# Altium schematic sheet SIO - IT8784E.schdoc
size 297 x 210 mm; Symbol: Sheet-Symbol_A4; Company: 嘉立创EDA; Version: V1.0; Page Size: A4; @Project Name: 【全网首发】X86电脑主板_copy; @Page Count: 13; @Update Date: 2025-10-09; @Create Date: 2025-10-09; @Schematic Name: SCHEMATIC1_1; @Page No: 0; @Page Name: SIO - IT8784E; Device: Sheet-Symbol_A4_1
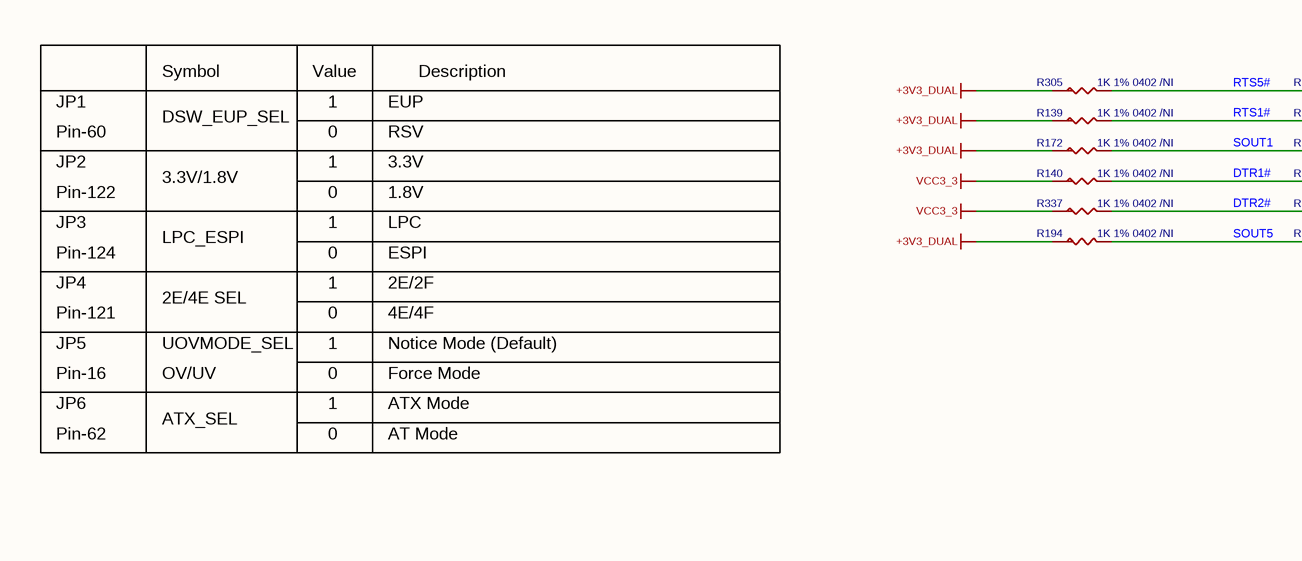
[diagram p0: SIO - IT8784E.schdoc, left]
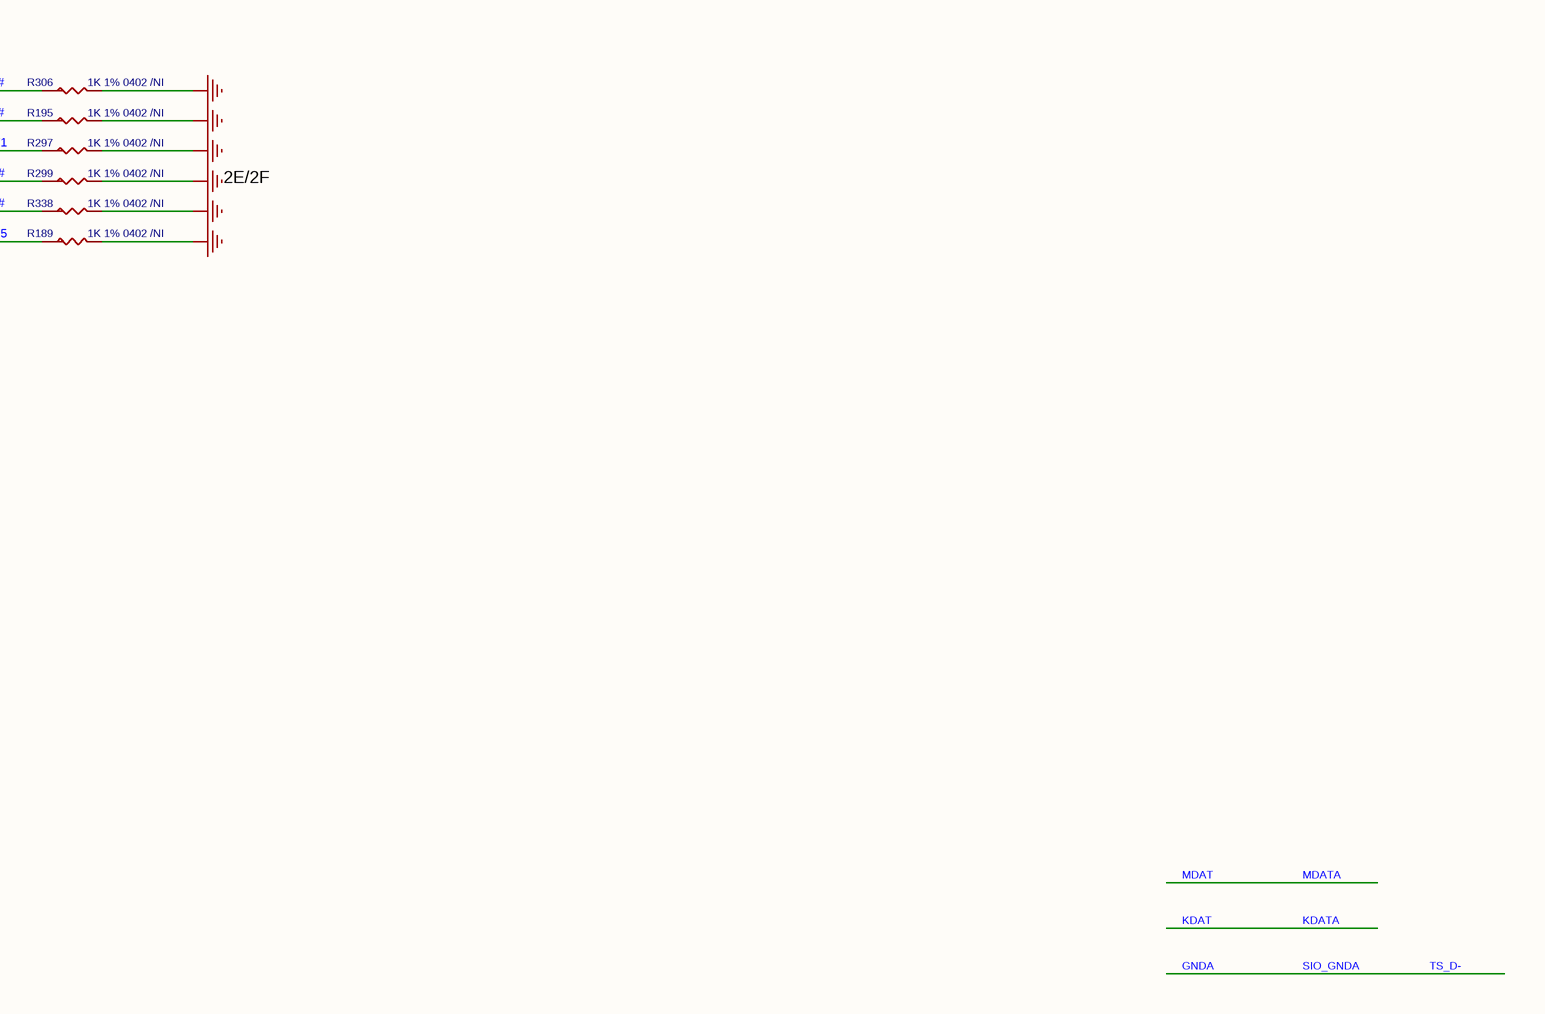
[diagram p1: SIO - IT8784E.schdoc, right]

## Parts
R139  value 1K 1% 0402 /NI  [R0402_2]  (hidden comment: R)
R140  value 1K 1% 0402 /NI  [R0402_2]  (hidden comment: R)
R172  value 1K 1% 0402 /NI  [R0402]  (hidden comment: R)
R189  value 1K 1% 0402 /NI  [R0402_1]  (hidden comment: R)
R194  value 1K 1% 0402 /NI  [R0402_3]  (hidden comment: R)
R195  value 1K 1% 0402 /NI  [R0402]  (hidden comment: R)
R297  value 1K 1% 0402 /NI  [R0402_2]  (hidden comment: R)
R299  value 1K 1% 0402 /NI  [R0402]  (hidden comment: R)
R305  value 1K 1% 0402 /NI  [R0402_3]  (hidden comment: R)
R306  value 1K 1% 0402 /NI  [R0402_1]  (hidden comment: R)
R337  value 1K 1% 0402 /NI  [R0402]  (hidden comment: R)
R338  value 1K 1% 0402 /NI  [R0402]  (hidden comment: R)

## Nets
+3V3_DUAL: R139.1 R172.1 R194.1 R305.1
GND: R189.2 R195.2 R297.2 R299.2 R306.2 R338.2
VCC3_3: R140.1 R337.1
DTR1#: R140.2 R299.1
DTR2#: R337.2 R338.1
RTS1#: R139.2 R195.1
RTS5#: R305.2 R306.1
SOUT1: R172.2 R297.1
SOUT5: R189.1 R194.2

## Notes on the sheet
- JP1
- Pin-60
- Symbol
- DSW_EUP_SEL
- Value
- 1
- 0
- EUP
- RSV
- Description
- Pin-122
- JP2
- 3.3V/1.8V
- 1.8V
- 3.3V
- 2E/2F
- JP3
- JP4
- Pin-124
- LPC_ESPI
- LPC
- ESPI
- Pin-121
- JP5
- 2E/4E SEL
- UOVMODE_SEL
- 4E/4F
- Notice Mode (Default)
- JP6
- Pin-62
- Pin-16
- ATX_SEL
- OV/UV
- ATX Mode
- AT Mode
- Force Mode
- 更新日期
- 2025-10-09
- 原理图
- 图页
- SCHEMATIC1_1
- SIO - IT8784E
- 创建日期
- 物料编码
- 审阅
- 绘制
- 【全网首发】X86电脑主板_copy
- 版本
- V1.0
- 尺寸
- A4
- 页
- 嘉立创EDA
- 共
- 13

## Library data of the parts
R139 R140 R297 = R_4: Manufacturer: UNI-ROYAL(厚声); Manufacturer Part: 0402WGF1001TCE; 3D Model: 671aefced39d4c318694bba8bd8efd39; 3D Model Transform: 39.37,19.685,0,0,0,0,0,0.0005,0; Tolerance: ±1%; Power(Watts): 62.5mW; Overload Voltage (Max): 50V; Temperature Coefficient: ±100ppm/℃; AddInBom: yes; Device: R_4; Symbol: R; LCSC Part Name: 1kΩ ±1% 62.5mW 厚膜电阻; Supplier Part: C11702; Supplier Footprint: 0402; JLCPCB Part Class: Basic Part; Datasheet: https://atta.szlcsc.com/upload/public/pdf/source/20200306/C422600_1E6D84923E4A46A82E41ADD87F860B5C.pdf; Supplier: LCSC; Type: 厚膜电阻; Operating Temperature Range: -55℃~+155℃; FootprintName: R0402_2; ConvertToPcb: yes
R172 R195 R299 R337 R338 = R: Manufacturer: UNI-ROYAL(厚声); Manufacturer Part: 0402WGF1001TCE; 3D Model: 671aefced39d4c318694bba8bd8efd39; 3D Model Transform: 39.37,19.685,0,0,0,0,0,0.0005,0; Tolerance: ±1%; Power(Watts): 62.5mW; Overload Voltage (Max): 50V; Temperature Coefficient: ±100ppm/℃; AddInBom: yes; Device: R; Symbol: R; LCSC Part Name: 1kΩ ±1% 62.5mW 厚膜电阻; Supplier Part: C11702; Supplier Footprint: 0402; JLCPCB Part Class: Basic Part; Datasheet: https://atta.szlcsc.com/upload/public/pdf/source/20200306/C422600_1E6D84923E4A46A82E41ADD87F860B5C.pdf; Supplier: LCSC; Type: 厚膜电阻; Operating Temperature Range: -55℃~+155℃; FootprintName: R0402; ConvertToPcb: yes
R189 R306 = R_3: Manufacturer: UNI-ROYAL(厚声); Manufacturer Part: 0402WGF1001TCE; 3D Model: 671aefced39d4c318694bba8bd8efd39; 3D Model Transform: 39.37,19.685,0,0,0,0,0,0.0005,0; Tolerance: ±1%; Power(Watts): 62.5mW; Overload Voltage (Max): 50V; Temperature Coefficient: ±100ppm/℃; AddInBom: yes; Device: R_3; Symbol: R; LCSC Part Name: 1kΩ ±1% 62.5mW 厚膜电阻; Supplier Part: C11702; Supplier Footprint: 0402; JLCPCB Part Class: Basic Part; Datasheet: https://atta.szlcsc.com/upload/public/pdf/source/20200306/C422600_1E6D84923E4A46A82E41ADD87F860B5C.pdf; Supplier: LCSC; Type: 厚膜电阻; Operating Temperature Range: -55℃~+155℃; FootprintName: R0402_1; ConvertToPcb: yes
R194 R305 = R_5: Manufacturer: UNI-ROYAL(厚声); Manufacturer Part: 0402WGF1001TCE; 3D Model: 671aefced39d4c318694bba8bd8efd39; 3D Model Transform: 39.37,19.685,0,0,0,0,0,0.0005,0; Tolerance: ±1%; Power(Watts): 62.5mW; Overload Voltage (Max): 50V; Temperature Coefficient: ±100ppm/℃; AddInBom: yes; Device: R_5; Symbol: R; LCSC Part Name: 1kΩ ±1% 62.5mW 厚膜电阻; Supplier Part: C11702; Supplier Footprint: 0402; JLCPCB Part Class: Basic Part; Datasheet: https://atta.szlcsc.com/upload/public/pdf/source/20200306/C422600_1E6D84923E4A46A82E41ADD87F860B5C.pdf; Supplier: LCSC; Type: 厚膜电阻; Operating Temperature Range: -55℃~+155℃; FootprintName: R0402_3; ConvertToPcb: yes